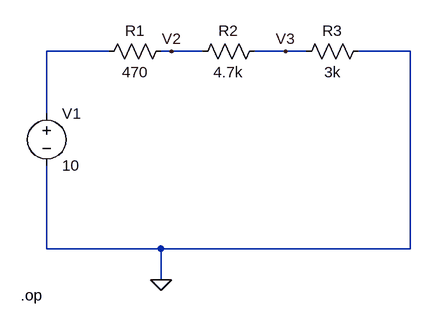
[diagram p0: schematic VDR.asc]
VDR.asc, the LTspice schematic file:
Version 4.1
SHEET 1 880 680
WIRE 144 112 48 112
WIRE 240 112 224 112
WIRE 288 112 240 112
WIRE 416 112 368 112
WIRE 448 112 416 112
WIRE 608 112 528 112
WIRE 48 208 48 112
WIRE 48 416 48 288
WIRE 224 416 48 416
WIRE 608 416 608 112
WIRE 608 416 224 416
WIRE 224 464 224 416
FLAG 224 464 0
FLAG 240 112 V2
FLAG 416 112 V3
SYMBOL voltage 48 192 R0
WINDOW 123 0 0 Left 0
WINDOW 39 0 0 Left 0
SYMATTR InstName V1
SYMATTR Value 10
SYMBOL res 128 128 R270
WINDOW 0 32 56 VTop 2
WINDOW 3 0 56 VBottom 2
SYMATTR InstName R1
SYMATTR Value 470
SYMBOL res 272 128 R270
WINDOW 0 32 56 VTop 2
WINDOW 3 0 56 VBottom 2
SYMATTR InstName R2
SYMATTR Value 4.7k
SYMBOL res 432 128 R270
WINDOW 0 32 56 VTop 2
WINDOW 3 0 56 VBottom 2
SYMATTR InstName R3
SYMATTR Value 3k
TEXT 8 488 Left 2 !.op

The netlist it stands for:
* VDR.asc
V1 N001 0 10
R1 N001 V2 470
R2 V2 V3 4.7k
R3 V3 0 3k
.op
.backanno
.end